# Altium schematic sheet Controller_Sheet.SchDoc
size 420 x 297 mm; SheetNumber: 3; SheetTotal: 5
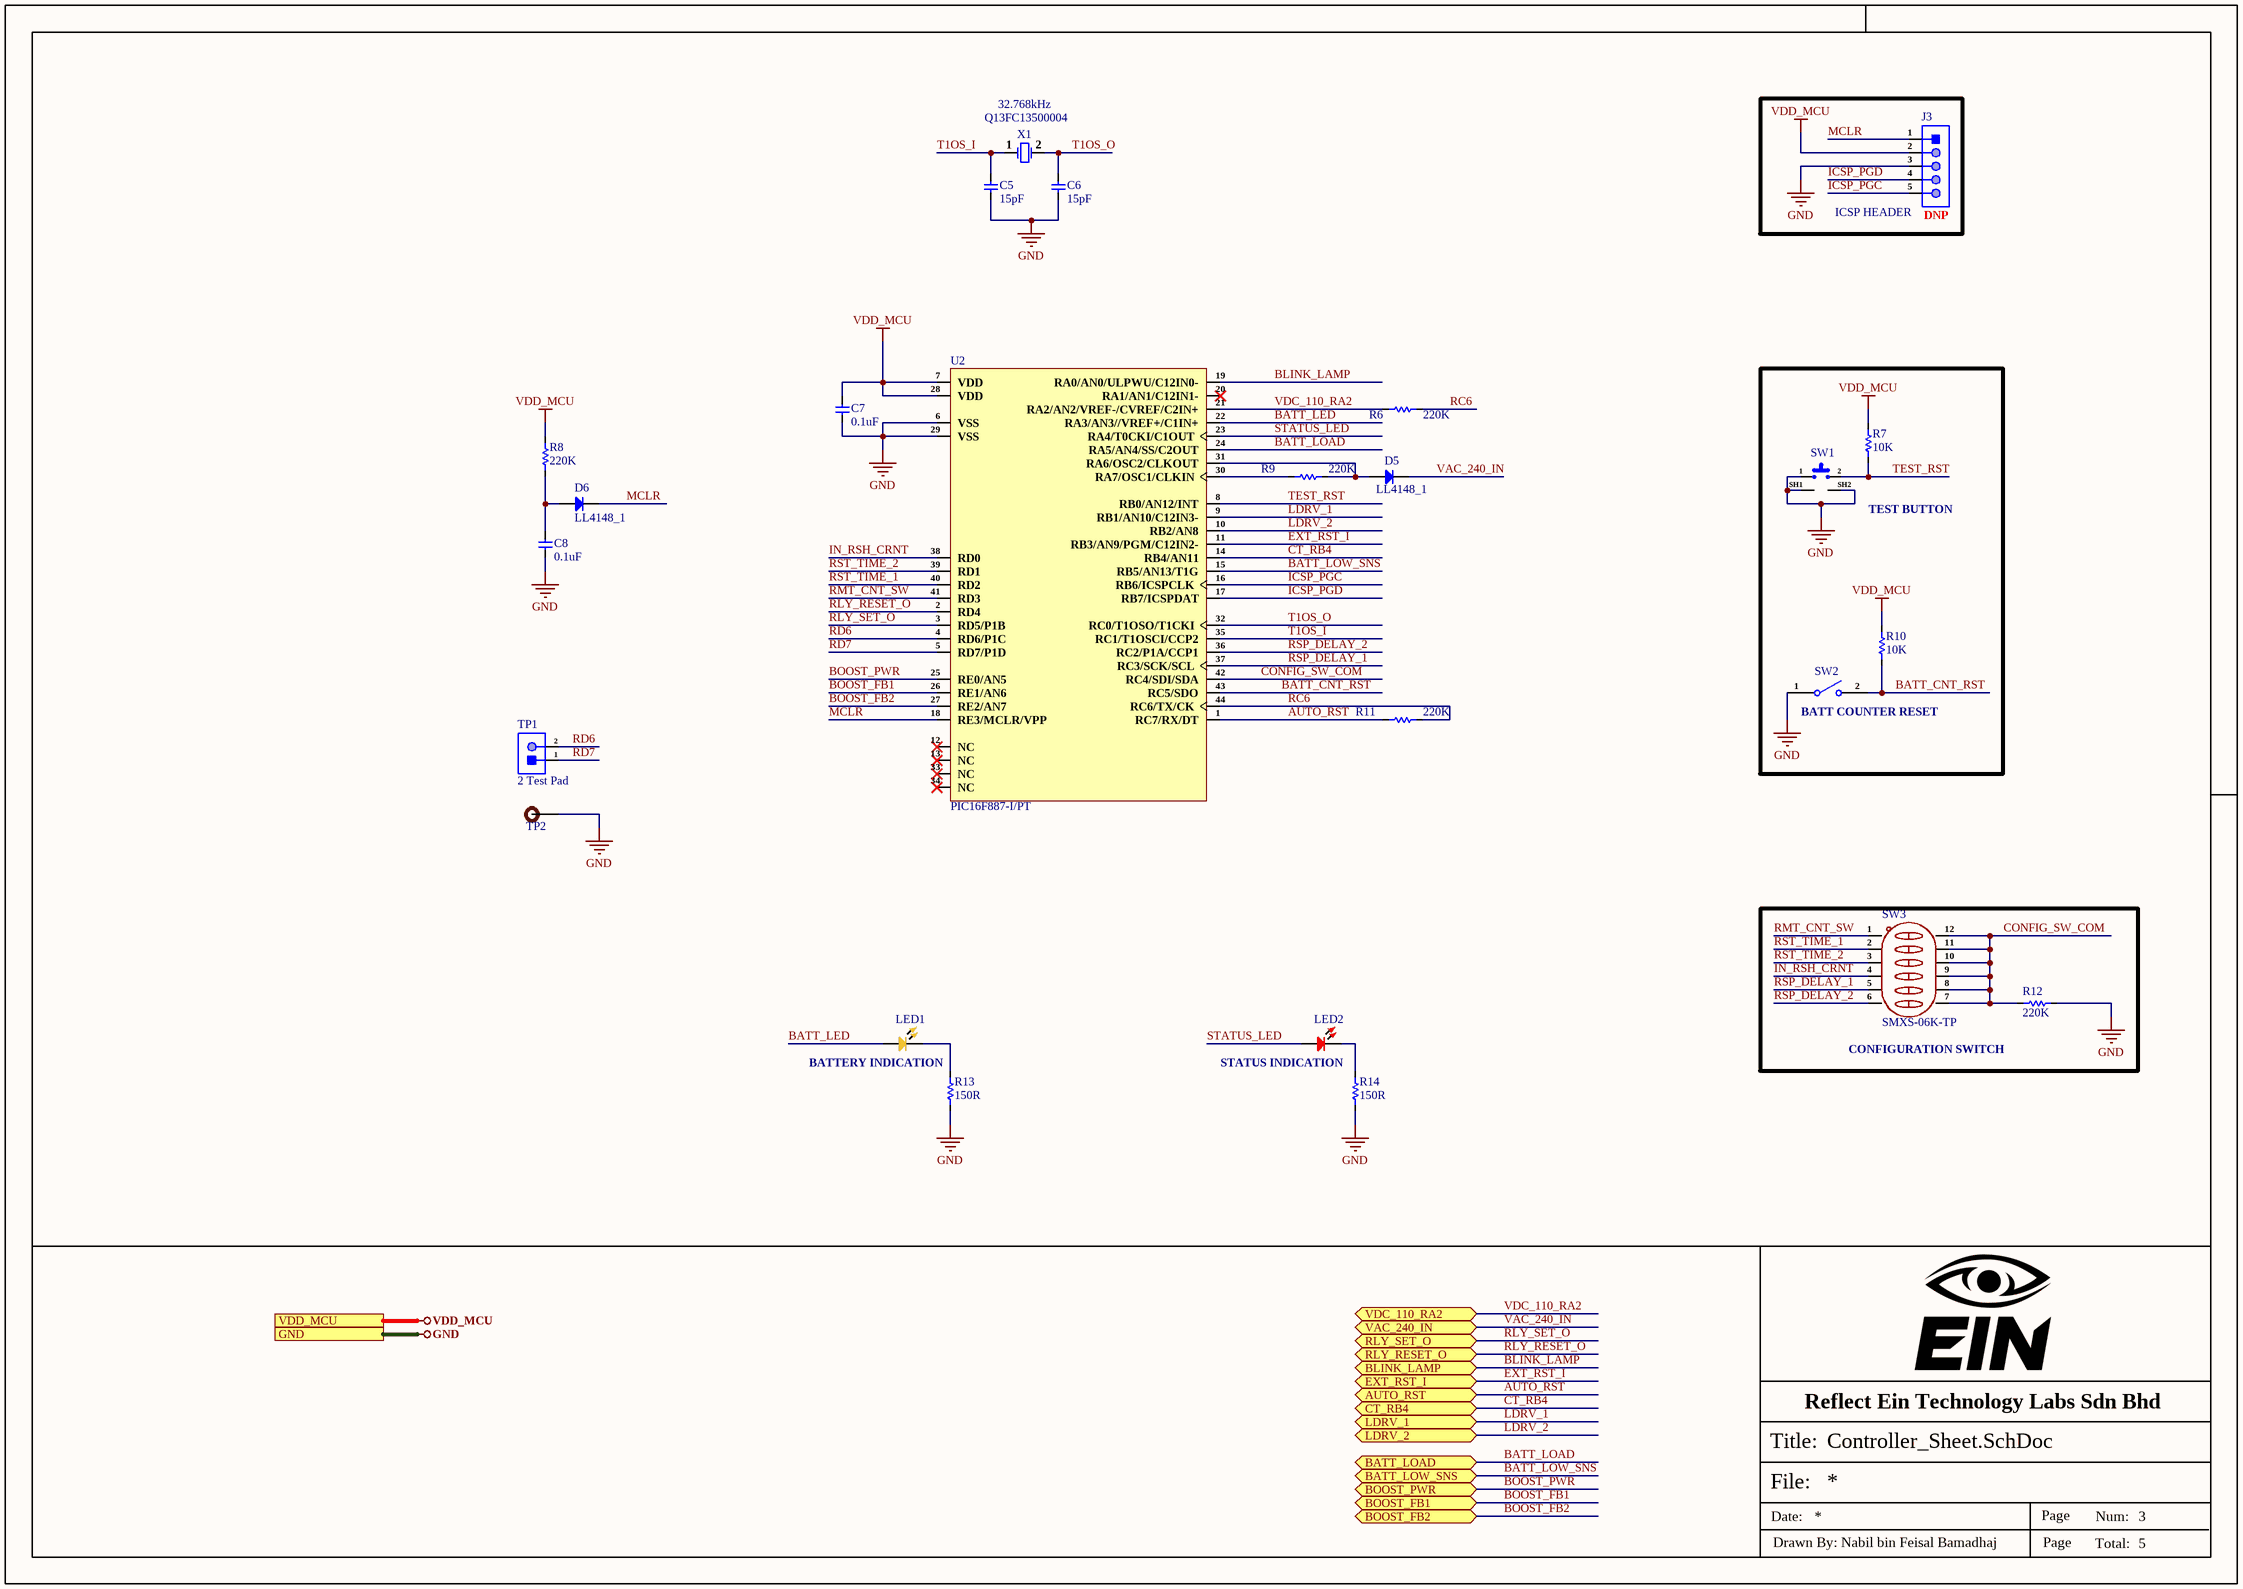
[diagram p0: Controller_Sheet.SchDoc]

## Parts
C5  15pF  [Cap-1206]
C6  15pF  [Cap-1206]
C7  0.1uF  [Cap-1206]
C8  0.1uF  [Cap-1206]
D5  LL4148_1  [LL-34]
D6  LL4148_1  [LL-34]
J3  X6511WV-05H-C60D30  [HDR1X5_]  (value not drawn)  (no BOM)
LED1  333-2UYD/S530-A3-L  [TH LED 5mm Yellow]  (value not drawn)
LED2  333-2SURC/S530-A3  [TH LED 5mm_]  (value not drawn)
R6  220K  [Res-1206]
R7  10K  [Res-1206]
R8  220K  [Res-1206]
R9  220K  [Res-1206]
R10  10K  [Res-1206]
R11  220K  [Res-1206]
R12  220K  [Res-1206]
R13  150R  [Res-1206]
R14  150R  [Res-1206]
SW1  1825027-8  [1825027-8]  (value not drawn)
SW2  FSM6JSMATR  [FSM6JSMATR]  (value not drawn)
SW3  SMXS-06K-TP  [SMXS-06K-TP]
TP1  2 Test Pad  [2 Test Pad]  (no BOM)
TP2  TEST POINT  [Test-point]  (value not drawn)  (no BOM)
U2  PIC16F887-I/PT  [44-TQFP (10x10)]
X1  Q13FC13500004  [SMD3215-2P]

## Blocks framed on the sheet
CONFIGURATION SWITCH: R12 SW3

## Ports
AUTO_RST (bidir, see Top-Sheet[3B], Peripheral_Sheet[3D]), BATT_LOAD (bidir, see Top-Sheet[3B], Power_Sheet[4D]), BATT_LOW_SNS (bidir, see Top-Sheet[3B], Power_Sheet[4D]), BLINK_LAMP (bidir, see Top-Sheet[3B], Peripheral_Sheet[3D]), BOOST_FB1 (bidir, see Top-Sheet[3B], Power_Sheet[4D]), BOOST_FB2 (bidir, see Top-Sheet[3B], Power_Sheet[4D]), BOOST_PWR (bidir, see Top-Sheet[3B], Power_Sheet[4D]), CT_RB4 (bidir, see Top-Sheet[3B], Peripheral_Sheet[3D]), EXT_RST_I (bidir, see Top-Sheet[3B], Peripheral_Sheet[3D]), GND (see Top-Sheet[3A], Connector_Sheet[1D], Peripheral_Sheet[1D], Power_Sheet[1D]), LDRV_1 (bidir, see Top-Sheet[3B], Peripheral_Sheet[3D]), LDRV_2 (bidir, see Top-Sheet[3B], Peripheral_Sheet[3D]), RLY_RESET_O (bidir, see Top-Sheet[3B], Peripheral_Sheet[3D]), RLY_SET_O (bidir, see Top-Sheet[3B], Peripheral_Sheet[3D]), VAC_240_IN (bidir, see Top-Sheet[3B], Peripheral_Sheet[3D]), VDC_110_RA2 (bidir, see Top-Sheet[3B], Peripheral_Sheet[3D]), VDD_MCU (see Top-Sheet[3A], Peripheral_Sheet[1D], Power_Sheet[1D])

## Nets
GND: C5.1 C6.1 C7.1 C8.1 J3.3 R12.1 R13.1 R14.1 SW1.1 SW1.SH1(GND) SW1.SH2(GND) SW2.1 TP2.1 U2.6(VSS) U2.29(VSS) ; port GND
VDD_MCU: C7.2 J3.2 R7.2 R8.2 R10.2 U2.7(VDD) U2.28(VDD) ; port VDD_MCU
AUTO_RST: R11.2 U2.1(RC7/RX/DT) ; port AUTO_RST
BATT_CNT_RST: R10.1 SW2.2 U2.43(RC5/SDO)
BATT_LED: LED1.2 U2.22(RA3/AN3//VREF+/C1IN+)
BATT_LOAD: U2.24(RA5/AN4/SS/C2OUT) ; port BATT_LOAD
BATT_LOW_SNS: U2.15(RB5/AN13/T1G) ; port BATT_LOW_SNS
BLINK_LAMP: U2.19(RA0/AN0/ULPWU/C12IN0-) ; port BLINK_LAMP
BOOST_FB1: U2.26(RE1/AN6) ; port BOOST_FB1
BOOST_FB2: U2.27(RE2/AN7) ; port BOOST_FB2
BOOST_PWR: U2.25(RE0/AN5) ; port BOOST_PWR
CONFIG_SW_COM: R12.2 SW3.7 SW3.8 SW3.9 SW3.10 SW3.11 SW3.12 U2.42(RC4/SDI/SDA)
CT_RB4: U2.14(RB4/AN11) ; port CT_RB4
EXT_RST_I: U2.11(RB3/AN9/PGM/C12IN2-) ; port EXT_RST_I
ICSP_PGC: J3.5 U2.16(RB6/ICSPCLK)
ICSP_PGD: J3.4 U2.17(RB7/ICSPDAT)
IN_RSH_CRNT: SW3.4 U2.38(RD0)
LDRV_1: U2.9(RB1/AN10/C12IN3-) ; port LDRV_1
LDRV_2: U2.10(RB2/AN8) ; port LDRV_2
MCLR: D6.1(K) J3.1 U2.18(RE3/MCLR/VPP)
RC6: R6.1 R11.1 U2.44(RC6/TX/CK)
RD6: TP1.2 U2.4(RD6/P1C)
RD7: TP1.1 U2.5(RD7/P1D)
RLY_RESET_O: U2.2(RD4) ; port RLY_RESET_O
RLY_SET_O: U2.3(RD5/P1B) ; port RLY_SET_O
RMT_CNT_SW: SW3.1 U2.41(RD3)
RSP_DELAY_1: SW3.5 U2.37(RC3/SCK/SCL)
RSP_DELAY_2: SW3.6 U2.36(RC2/P1A/CCP1)
RST_TIME_1: SW3.2 U2.40(RD2)
RST_TIME_2: SW3.3 U2.39(RD1)
STATUS_LED: LED2.1 U2.23(RA4/T0CKI/C1OUT)
T1OS_I: C5.2 U2.35(RC1/T1OSCI/CCP2) X1.1(OSC1)
T1OS_O: C6.2 U2.32(RC0/T1OSO/T1CKI) X1.2(OSC2)
TEST_RST: R7.1 SW1.2 U2.8(RB0/AN12/INT)
VAC_240_IN: D5.1(K) ; port VAC_240_IN
VDC_110_RA2: R6.2 U2.21(RA2/AN2/VREF-/CVREF/C2IN+) ; port VDC_110_RA2
NetC8_2: C8.2 D6.2(A) R8.1
NetD5_2: D5.2(A) R9.1 U2.31(RA6/OSC2/CLKOUT)
NetLED1_1: LED1.1 R13.2
NetLED2_2: LED2.2 R14.2
NetR9_2: R9.2 U2.30(RA7/OSC1/CLKIN)

Not connected (* = marked no-connect by the designer): U2 12(NC)* 13(NC)* 20(RA1/AN1/C12IN1-)* 33(NC)* 34(NC)*

## Notes on the sheet
- (near X1) 32.768kHz
- (near J3) ICSP HEADER
- (near J3) DNP
- TEST BUTTON
- (near SW2) BATT COUNTER RESET
- (near LED1) BATTERY INDICATION
- (near LED2) STATUS INDICATION
- Reflect Ein Technology Labs Sdn Bhd
- File:
- Title:
- Date:
- Page
- Num:
- Total:
- Drawn By: Nabil bin Feisal Bamadhaj

## Library data of the parts
C5 C6 = CC1206JRNPO9BN150: CAP CER 15PF 50V C0G/NPO 1206; Manufacturer: Yageo; Item Type: Capacitors; Supplier: Future Electronics; LCSC Part Number: C541476; Manufacturer Part Number: CC1206JRNPO9BN150; RoHS: Yes; Stock: 4000; Pricing: 4000=0.0232, 12000=0.0227, 16000=0.0225, 40000=0.022, 60000=0.0216 (USD); Lead Free: 5697LeadFree; Halogen Free: 5694HalogenFree; ComponentLink1URL: https://datasheet.ciiva.com/156/mlccorderingcode-156381.pdf?src-supplier=Digikey; ComponentLink1Description: https://datasheet.ciiva.com/156/mlccorderingcode-156381.pdf?src-supplier=Digikey; ComponentLink2URL: https://datasheet.ciiva.com/156/mlccorderingcode-156382.pdf?src-supplier=Digikey; ComponentLink2Description: https://datasheet.ciiva.com/156/mlccorderingcode-156382.pdf?src-supplier=Digikey; ComponentLink3URL: https://datasheet.ciiva.com/156/mlccorderingcode-156383.pdf?src-supplier=Digikey; ComponentLink3Description: https://datasheet.ciiva.com/156/mlccorderingcode-156383.pdf?src-supplier=Digikey; ComponentLink4URL: https://datasheet.ciiva.com/26863/getdatasheetpartid-94181-26863045.pdf?src-supplier=Verical; ComponentLink4Description: https://datasheet.ciiva.com/26863/getdatasheetpartid-94181-26863045.pdf?src-supplier=Verical; ComponentLink5URL: https://datasheet.ciiva.com/29242/445461-da-01-en-kerko-chip-1206-np0-15pf-5proz-50vg-29242151.pdf?src-supplier=Conrad; ComponentLink5Description: https://datasheet.ciiva.com/29242/445461-da-01-en-kerko-chip-1206-np0-15pf-5proz-50vg-29242151.pdf?src-supplier=Conrad
C7 C8 = CC1206KRX7R9BB104: CAP CER 0.1UF 50V X7R 1206; Manufacturer: Yageo; Item Type: Capacitor; Material: Ceramic; Value: 100nF; Tolerance: 10%; Insulation Resistance: 100GR; Supplier: Digikey; LCSC Part Number: 311-1179-1-ND; Manufacturer Part Number: CC1206KRX7R9BB104; RoHS: Yes; Stock: 520624; Pricing: 1=0.19, 10=0.128, 50=0.0764, 100=0.0601, 500=0.04436, 1000=0.03672 (USD); Mounting Technology: Surface Mount; Case/Package: 1206; Pins: 2; Case Code (Metric): 3216; Case Code (Imperial): 1206; Min Operating Temperature: -55°C; Max Operating Temperature: 125°C; Dielectric: X7R; Packaging: Tape and Reel; Voltage Rating: 50V; Termination: SMD/SMT; Voltage: 50V; Voltage Rating (DC): 50V; Series: CC; Length: 3.2mm; Height: 0.85mm; Depth: 1.6mm; Radiation Hardening: No; RoHS Compliant: Yes; Reach SVHC Compliant: Unknown; Lead Free: 5697LeadFree; Halogen Free: 5694HalogenFree; ComponentLink1URL: https://datasheet.ciiva.com/11786/0900766b80d84f1d-11786968.pdf?src-supplier=Rs; ComponentLink1Description: https://datasheet.ciiva.com/11786/0900766b80d84f1d-11786968.pdf?src-supplier=Rs; ComponentLink2URL: https://datasheet.ciiva.com/7978/1489800-7978230.pdf?src-supplier=Element14; ComponentLink2Description: https://datasheet.ciiva.com/7978/1489800-7978230.pdf?src-supplier=Element14; ComponentLink3URL: https://datasheet.ciiva.com/28450/1489800-28450892.pdf?src-supplier=Element14; ComponentLink3Description: https://datasheet.ciiva.com/28450/1489800-28450892.pdf?src-supplier=Element14; ComponentLink4URL: https://datasheet.ciiva.com/144/mlccorderingcode-144906.pdf?src-supplier=Digikey; ComponentLink4Description: https://datasheet.ciiva.com/144/mlccorderingcode-144906.pdf?src-supplier=Digikey; ComponentLink5URL: https://datasheet.ciiva.com/144/mlccorderingcode-144905.pdf?src-supplier=Digikey; ComponentLink5Description: https://datasheet.ciiva.com/144/mlccorderingcode-144905.pdf?src-supplier=Digikey; ComponentLink6URL: https://datasheet.ciiva.com/144/mlccorderingcode-144907.pdf?src-supplier=Digikey; ComponentLink6Description: https://datasheet.ciiva.com/144/mlccorderingcode-144907.pdf?src-supplier=Digikey; ComponentLink7URL: https://datasheet.ciiva.com/5425/upy-gp-np0-16v-to-50v-8-3714-5425561.pdf?src-supplier=Mouser; ComponentLink7Description: https://datasheet.ciiva.com/5425/upy-gp-np0-16v-to-50v-8-3714-5425561.pdf?src-supplier=Mouser; ComponentLink8URL: https://datasheet.ciiva.com/28363/1734573-28363672.pdf?src-supplier=Element14; ComponentLink8Description: https://datasheet.ciiva.com/28363/1734573-28363672.pdf?src-supplier=Element14; ComponentLink9URL: https://datasheet.ciiva.com/46385/1734573-46385063.pdf?src-supplier=Element14; ComponentLink9Description: https://datasheet.ciiva.com/46385/1734573-46385063.pdf?src-supplier=Element14; ComponentLink10URL: https://datasheet.ciiva.com/15189/getdatasheetpartid-251811-15189275.pdf?src-supplier=Verical; ComponentLink10Description: https://datasheet.ciiva.com/15189/getdatasheetpartid-251811-15189275.pdf?src-supplier=Verical
D5 D6 = LL4148_1: 100V 1V@50mA 4ns 300mA LL-34 Switching Diodes ROHS; Manufacturer: Yangzhou Yangjie Elec Tech; Manufacturer Part Number: LL4148; Item Type: Diode; Package: LL-34; LCSC Part Number: C211750; ComponentLink1Description: LCSC; ComponentLink1URL: https://www.lcsc.com/product-detail/Switching-Diodes_Yangzhou-Yangjie-Elec-Tech-LL4148_C211750.html
J3 = X6511WV-05H-C60D30: Gold 250V 3A Straight Square Pins 2.5mm 5P 260℃ 6mm -40℃~+105℃ 3mm 2.54mm Plugin Black Brass 1x5P Plugin,P=2.54mm Pin Headers ROHS; Manufacturer: XKB; Item Type: Male Header; ComponentLink1Description: LCSC; ComponentLink1URL: https://www.lcsc.com/product-detail/Pin-Headers_XKB-Connectivity-X6511WV-05H-C60D30_C706877.html; Manufacturer Part Number: X6511WV-05H-C60D30; Package: Plugin,P=2.54mm; LCSC Part Number: C706877
LED1 = 333-2UYD/S530-A3-L: LED YELLOW DIFFUSED 5MM T/H; Manufacturer: Everlight; Supplier: Digikey; LCSC Part Number: C88602; Manufacturer Part Number: 333-2UYD/S530-A3-L; RoHS: No; Item Type: LED
LED2 = 333-2SURC/S530-A3: LED RED CLEAR 5MM ROUND T/H; Manufacturer: Everlight; Item Type: LEDs; Supplier: Mouser; LCSC Part Number: C125756; Manufacturer Part Number: 333-2SURC/S530-A3; RoHS: Yes; Stock: 2460; Pricing: 1=0.45, 10=0.259, 50=0.259, 100=0.127, 1000=0.11, 10000=0.089 (USD); ComponentLink1URL: https://datasheet.ciiva.com/14183/07501489-14183693.pdf?src-supplier=Distrelec; ComponentLink1Description: https://datasheet.ciiva.com/14183/07501489-14183693.pdf?src-supplier=Distrelec; ComponentLink2URL: https://datasheet.ciiva.com/2119/333-2surc-s530-a3-2119388.pdf?src-supplier=Digikey; ComponentLink2Description: https://datasheet.ciiva.com/2119/333-2surc-s530-a3-2119388.pdf?src-supplier=Digikey
R6 R8 R9 R11 R12 = RT1206BRD07220KL: RES SMD 220K OHM 0.1% 1/4W 1206; Manufacturer: Yageo; Item Type: Resistors; Voltage Rating (DC): 200V; Supplier: Digikey; LCSC Part Number: C309663; Manufacturer Part Number: RT1206BRD07220KL; RoHS: Yes; Stock: 10004; Pricing: 1=0.34, 10=0.225, 50=0.1816, 100=0.1663, 500=0.1326, 1000=0.11628 (USD); Lead Free: 5697LeadFree; ComponentLink1URL: https://datasheet.ciiva.com/2587/pyu-rt-1-to-0-05-rohs-l-5-2587527.pdf?src-supplier=Digikey; ComponentLink1Description: https://datasheet.ciiva.com/2587/pyu-rt-1-to-0-05-rohs-l-5-2587527.pdf?src-supplier=Digikey
R7 R10 = AC1206FR-7W10KL: RES 10K OHM 1% 1/2W 1206; Manufacturer: Yageo; Item Type: Resistors; Value: 10kR; Supplier: Mouser; LCSC Part Number: C326700; Manufacturer Part Number: AC1206FR-7W10KL; RoHS: No; Stock: 10222; Pricing: 1=0.14, 10=0.052, 50=0.052, 100=0.029, 1000=0.018, 10000=0.011 (USD); Case/Package: 340Case; Packaging: 10Packaging
R13 R14 = FRC1206F1500TS: 250mW Thick Film Resistors 200V ±100ppm/℃ ±1% 150Ω 1206 Chip Resistor - Surface Mount ROHS; Manufacturer: FOJAN; Manufacturer Part Number: FRC1206F1500TS; Package: 1206; LCSC Part Number: C2933598; Item Type: Resistor; ComponentLink1Description: LCSC; ComponentLink1URL: https://www.lcsc.com/product-detail/Chip-Resistor-Surface-Mount_FOJAN-FRC1206F1500TS_C2933598.html
SW1 = 1825027-8: 50mA Lying SPST 24V Plugin Tactile Switches ROHS; Manufacturer: TE Connectivity; Supplier 1: Arrow Electronics; Manufacturer Part Number: 1825027-8; RoHS: Yes; Category: Pushbutton Switches; Stock 1: 178529; Pricing 1: 1=0.13800, 10=0.13370, 25=0.12590, 100=0.10940, 250=0.10570, 500=0.09520, 1000=0.07320, 2500=0.07250, 5000=0.06250 (USD); ComponentLink1URL: https://datasheet.ciiva.com/30072/eng-cd-1825027-f-30072833.pdf?src-supplier=Onlinecomponents.com; ComponentLink1Description: https://datasheet.ciiva.com/30072/eng-cd-1825027-f-30072833.pdf?src-supplier=Onlinecomponents.com; ComponentLink2URL: https://datasheet.ciiva.com/16393/1825027-8-16393346.pdf?src-supplier=Future+Electronics; ComponentLink2Description: https://datasheet.ciiva.com/16393/1825027-8-16393346.pdf?src-supplier=Future+Electronics; ComponentLink3URL: https://datasheet.ciiva.com/8164/eng-cd-1825027-g4-8164921.pdf?src-supplier=Avnet; ComponentLink3Description: https://datasheet.ciiva.com/8164/eng-cd-1825027-g4-8164921.pdf?src-supplier=Avnet; Supplier Part Number 1: 1825027-8; Item Type: Tactile Switch
SW2 = FSM6JSMATR: SWITCH TACTILE SPST-NO 0.05A 24V; Manufacturer: TE Connectivity Alcoswitch; Item Type: Switches; Number of Positions: 2NUMBER; Supplier: Rs; LCSC Part Number: C6558197; Manufacturer Part Number: FSM6JSMATR; RoHS: Yes; Stock: 735; RoHS Compliant: 5897YesNo; ComponentLink1URL: https://datasheet.ciiva.com/7097/1486952-7097325.pdf?src-supplier=Newark; ComponentLink1Description: https://datasheet.ciiva.com/7097/1486952-7097325.pdf?src-supplier=Newark; ComponentLink2URL: https://datasheet.ciiva.com/1530/1714712-1530976.pdf?src-supplier=Element14; ComponentLink2Description: https://datasheet.ciiva.com/1530/1714712-1530976.pdf?src-supplier=Element14; ComponentLink3URL: https://datasheet.ciiva.com/15184/getdatasheetpartid-167889-15184443.pdf?src-supplier=Verical; ComponentLink3Description: https://datasheet.ciiva.com/15184/getdatasheetpartid-167889-15184443.pdf?src-supplier=Verical; ComponentLink4URL: https://datasheet.ciiva.com/8082/eng-cs-1308111-1-switches-core-program-catalog-0308-8082682.pdf?src-supplier=Avnet; ComponentLink4Description: https://datasheet.ciiva.com/8082/eng-cs-1308111-1-switches-core-program-catalog-0308-8082682.pdf?src-supplier=Avnet
SW3 = SMXS-06K-TP: 6 digits 24V Black 25mA 3000 Times SMD DIP Switches ROHS; Manufacturer: SM Switch; Manufacturer Part Number: SMXS-06K-TP; Package: SMD; LCSC Part Number: C5439765; Item Type: DIP SWITCH; ComponentLink1Description: LCSC; ComponentLink1URL: https://www.lcsc.com/product-detail/DIP-Switches_SM-Switch-SMXS-06K-TP_C5439765.html
TP1 = 2 Test Pad: Wire Connecting Pad; Item Type: Test Point; Manufacturer Part Number: 2 Test Pad
TP2 = TEST POINT: Test Point ON; Item Type: TEST POINT
U2 = PIC16F887-I/PT: IC MCU 8BIT 14KB FLASH 44TQFP; Manufacturer: Microchip; Access Time: 20us; Supplier: Arrow Electronics; LCSC Part Number: C31511; Manufacturer Part Number: PIC16F887-I/PT; RoHS: Yes; Item Type: IC; Stock: 46; Pricing: 1=2.91 (USD); Lead Free: 5697LeadFree; ComponentLink1URL: https://datasheet.ciiva.com/6149/41291f-6149840.pdf?src-supplier=Farnell; ComponentLink1Description: https://datasheet.ciiva.com/6149/41291f-6149840.pdf?src-supplier=Farnell; ComponentLink2URL: https://datasheet.ciiva.com/29119/160450-da-01-en-pic-pic16f887-i-pt-29119396.pdf?src-supplier=Conrad; ComponentLink2Description: https://datasheet.ciiva.com/29119/160450-da-01-en-pic-pic16f887-i-pt-29119396.pdf?src-supplier=Conrad; ComponentLink3URL: https://datasheet.ciiva.com/1489/41291g-1489550.pdf?src-supplier=Digikey; ComponentLink3Description: https://datasheet.ciiva.com/1489/41291g-1489550.pdf?src-supplier=Digikey; ComponentLink4URL: https://datasheet.ciiva.com/3203/41291f-3203503.pdf?src-supplier=Avnet; ComponentLink4Description: https://datasheet.ciiva.com/3203/41291f-3203503.pdf?src-supplier=Avnet; ComponentLink5URL: https://datasheet.ciiva.com/16211/filehandler-aspxddocname-en027084-16211484.pdf?src-supplier=Future+Electronics; ComponentLink5Description: https://datasheet.ciiva.com/16211/filehandler-aspxddocname-en027084-16211484.pdf?src-supplier=Future+Electronics; ComponentLink6URL: https://datasheet.ciiva.com/7892/41291f-7892232.pdf?src-supplier=Element14; ComponentLink6Description: https://datasheet.ciiva.com/7892/41291f-7892232.pdf?src-supplier=Element14; ComponentLink7URL: https://datasheet.ciiva.com/7892/1681365-7892233.pdf?src-supplier=Element14; ComponentLink7Description: https://datasheet.ciiva.com/7892/1681365-7892233.pdf?src-supplier=Element14
X1 = Q13FC13500004: 32.768kHz Surface Mount Crystal 12.5pF ±20ppm SMD3215-2P Crystals ROHS; Manufacturer: Epson; Supplier: Farnell; LCSC Part Number: C32346; Manufacturer Part Number: Q13FC13500004; RoHS: Yes; Item Type: Crystals; Stock: 52665; Reach SVHC Compliant: 4187SVHC; ComponentLink1URL: https://datasheet.octopart.com/Q13FC13500004-Epson-datasheet-62043850.pdf?src-supplier=Farnell; ComponentLink1Description: https://datasheet.octopart.com/Q13FC13500004-Epson-datasheet-62043850.pdf?src-supplier=Farnell; ComponentLink2URL: https://datasheet.octopart.com/Q13FC13500004-Epson-datasheet-32025749.pdf?src-supplier=Newark; ComponentLink2Description: https://datasheet.octopart.com/Q13FC13500004-Epson-datasheet-32025749.pdf?src-supplier=Newark